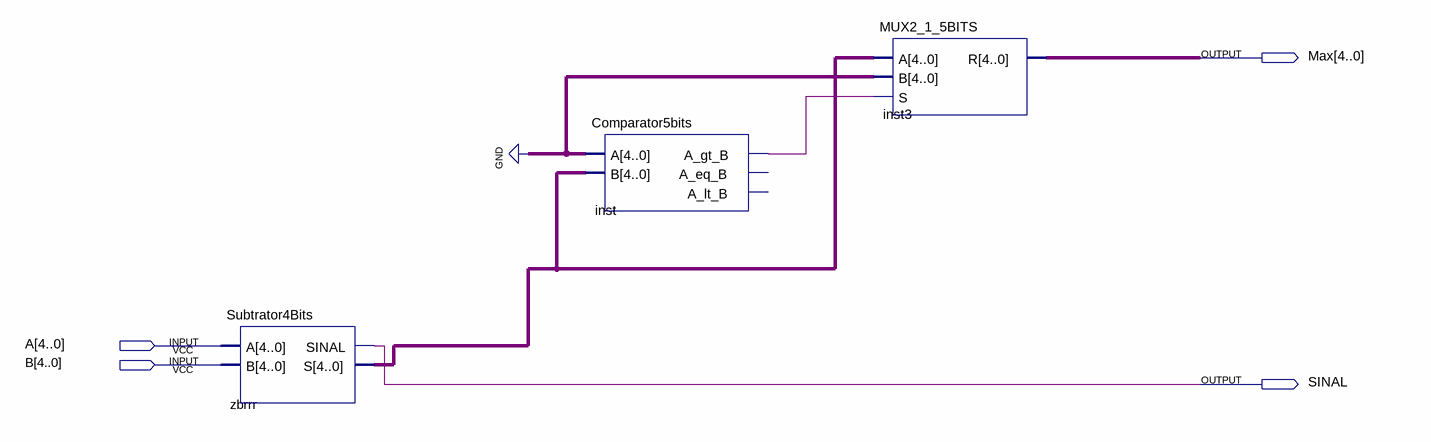
[diagram p0: schematic sheet]
// Quartus schematic Max_5bits_zero_dif.bdf as structural Verilog: 3 symbols, 4 pins
module Max_5bits_zero_dif (
  input  [4:0] A,
  input  [4:0] B,
  output [4:0] Max,
  output SINAL
);

  wire inst_a_gt_b;
  wire [4:0] zbrrr_s;

  Subtrator4Bits zbrrr (.A(A), .B(B), .SINAL(SINAL), .S(zbrrr_s));
  Comparator5bits inst (.A({5{1'b0}}), .B(zbrrr_s), .A_gt_B(inst_a_gt_b));  // open: A_eq_B, A_lt_B
  MUX2_1_5BITS inst3 (.A(zbrrr_s), .B({5{1'b0}}), .S(inst_a_gt_b), .R(Max));
endmodule
